# Altium schematic sheet DevKitESP32.SchDoc
size A; SheetNumber: 1; SheetTotal: 6
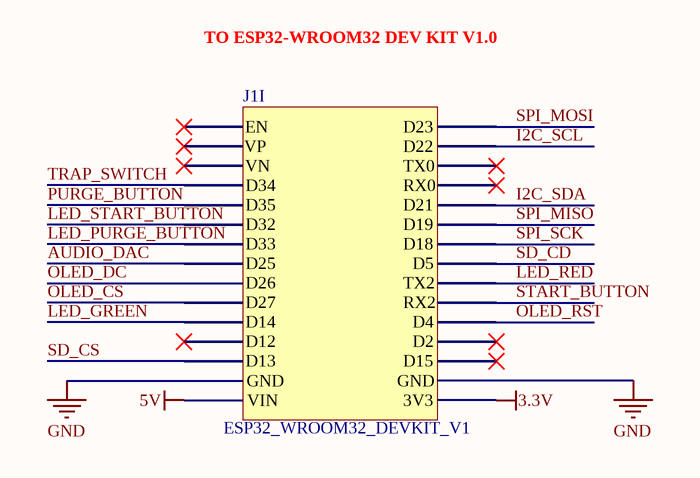
[diagram p0: DevKitESP32.SchDoc]

## Parts
J1  J1  [ESP32-DEVKIT-V1-FOOTPRINT]  (value not drawn)  (part I of 10)

## Nets
3.3V: J1.16(3V3)
5V: J1.15(VIN)
GND: J1.14(GND) J1.17(GND)
AUDIO_DAC: J1.8(D25)
I2C_SCL: J1.29(D22)
I2C_SDA: J1.26(D21)
LED_GREEN: J1.11(D14)
LED_PURGE_BUTTON: J1.7(D33)
LED_RED: J1.22(TX2)
LED_START_BUTTON: J1.6(D32)
OLED_CS: J1.10(D27)
OLED_DC: J1.9(D26)
OLED_RST: J1.20(D4)
PURGE_BUTTON: J1.5(D35)
SD_CD: J1.23(D5)
SD_CS: J1.13(D13)
SPI_MISO: J1.25(D19)
SPI_MOSI: J1.30(D23)
SPI_SCK: J1.24(D18)
START_BUTTON: J1.21(RX2)
TRAP_SWITCH: J1.4(D34)

Not connected (* = marked no-connect by the designer): J1 1(EN)* 2(VP)* 3(VN)* 12(D12)* 18(D15)* 19(D2)* 27(RX0)* 28(TX0)*

## Notes on the sheet
- TO ESP32-WROOM32 DEV KIT V1.0
- (in symbol Component_1, part I) ESP32_WROOM32_DEVKIT_V1

## Library data of the parts
J1 = Component_1